# EAGLE schematic LED Driver (EAGLE 9.7.0)
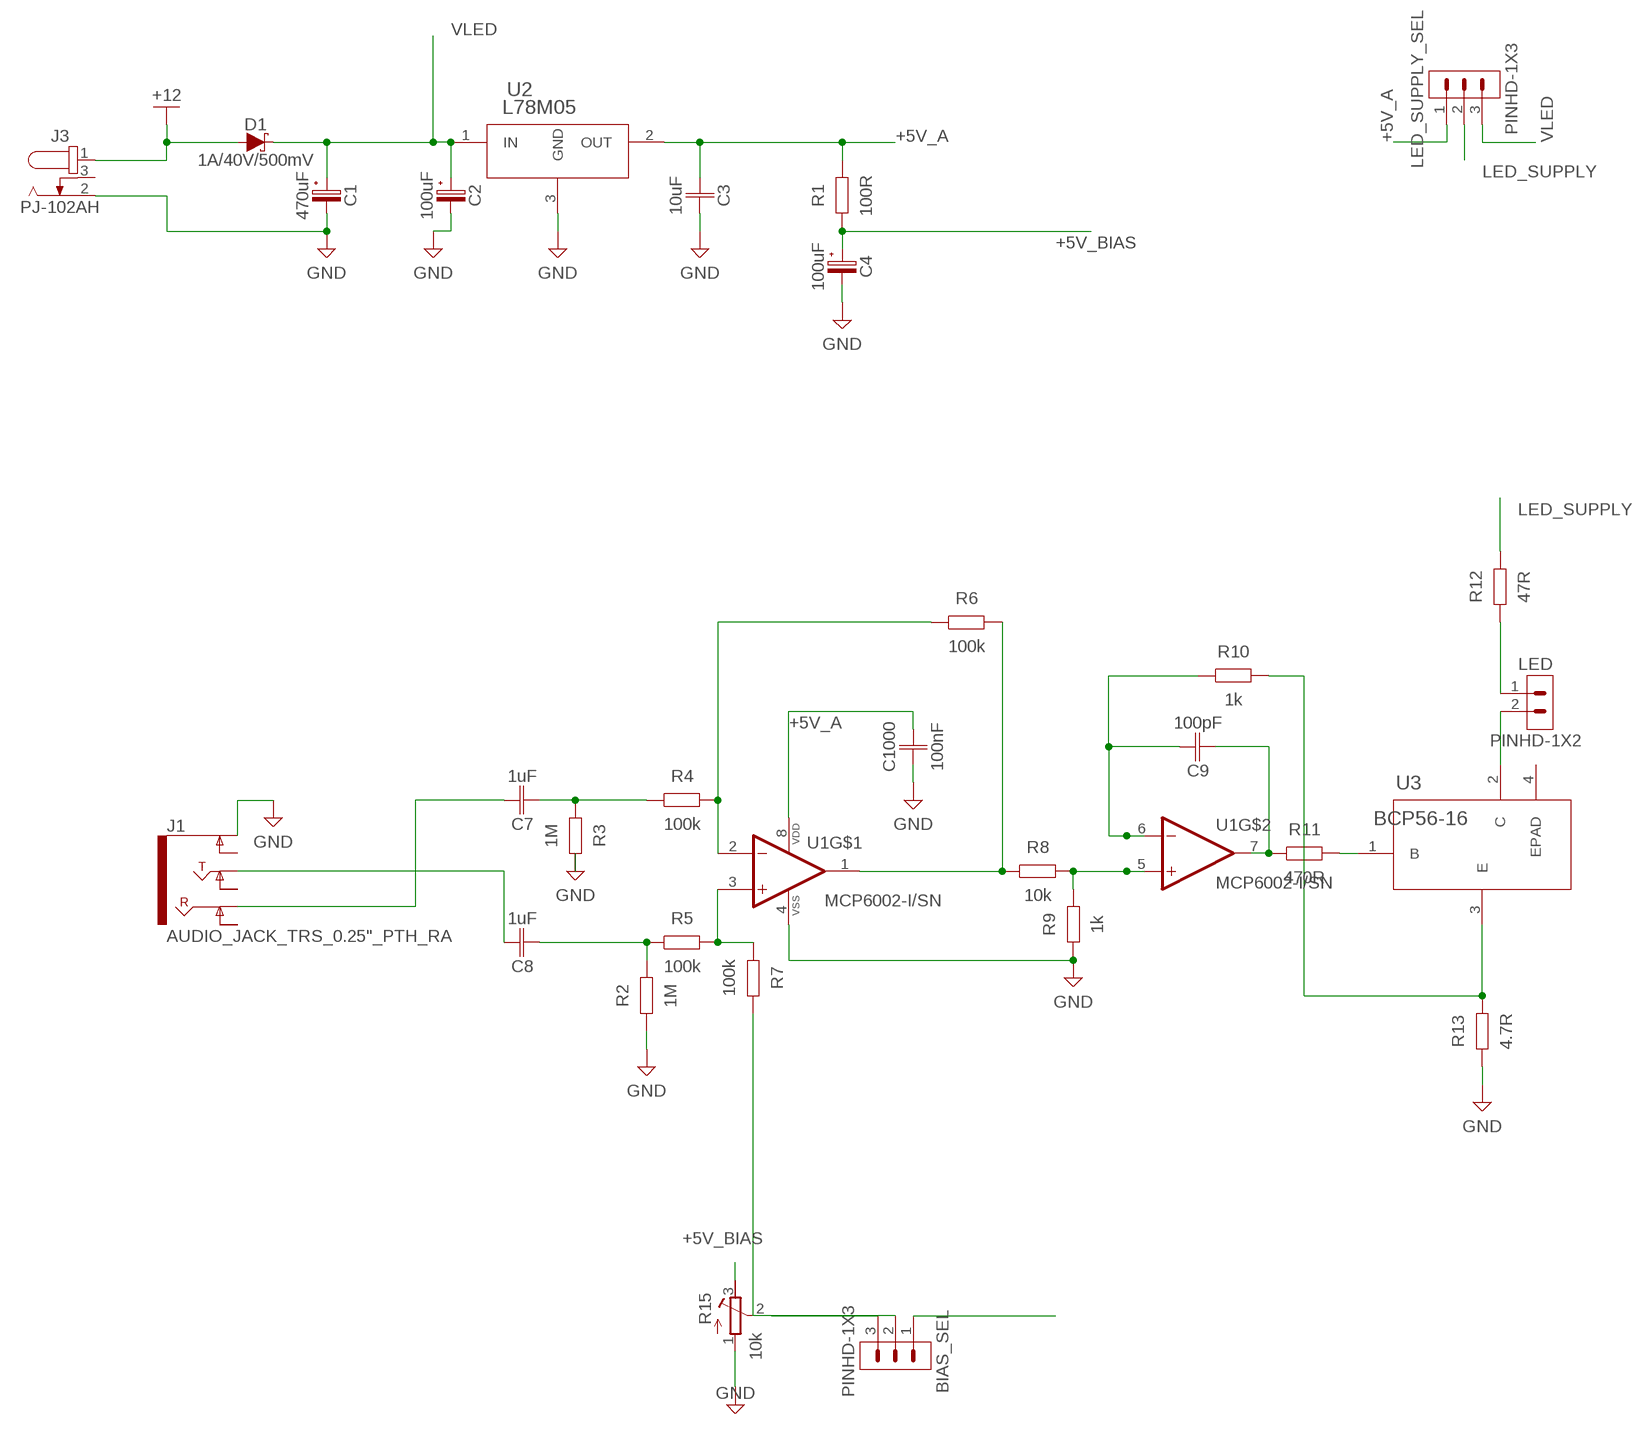
[diagram p0: schematic, sheet 1, part 1 of 2]
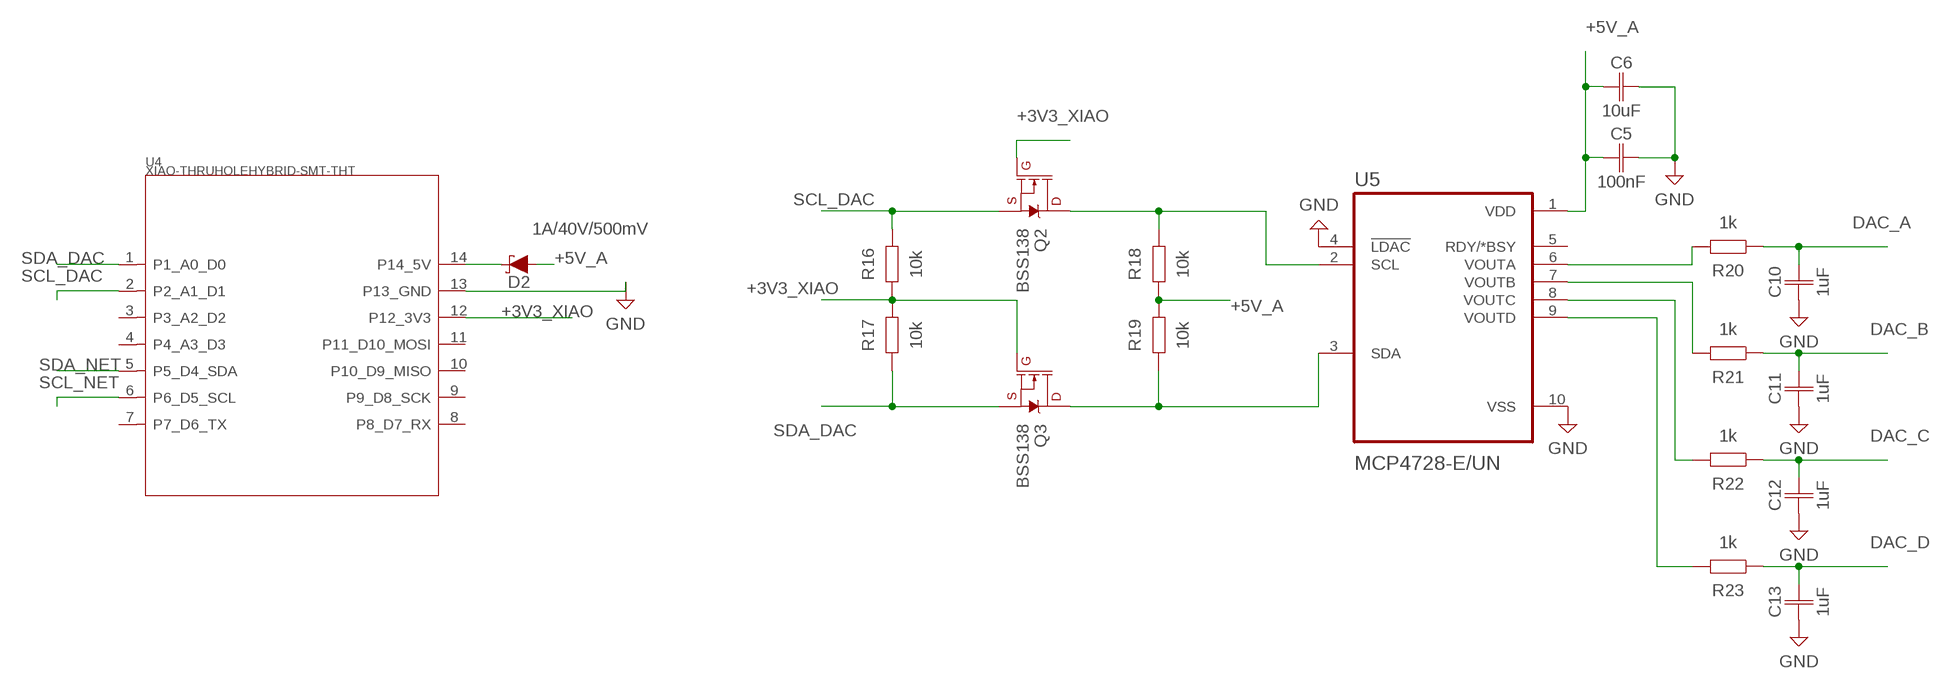
[diagram p1: schematic, sheet 1, part 2 of 2]

## Parts
BIAS_SEL  PINHD-1X3  [1X03]
C1  470uF  C-POL_ECAP-10.5MM  [CAPAE1030X1050N]
C2  100uF  C-POL_ECAP-8.5MM  [CAPAE830X1050N]
C3  10uF  C_CHIP-1206(3216-METRIC)  [CAPC3216X135]
C4  100uF  C-POL_ECAP-8.5MM  [CAPAE830X1050N]
C5  100nF  C_CHIP-0805(2012-METRIC)  [CAPC2012X110]
C6  10uF  C_CHIP-1206(3216-METRIC)  [CAPC3216X135]
C7  1uF  C_CHIP-1206(3216-METRIC)  [CAPC3216X135]
C8  1uF  C_CHIP-1206(3216-METRIC)  [CAPC3216X135]
C9  100pF  C_CHIP-0805(2012-METRIC)  [CAPC2012X110]
C10  1uF  C_CHIP-1206(3216-METRIC)  [CAPC3216X135]
C11  1uF  C_CHIP-1206(3216-METRIC)  [CAPC3216X135]
C12  1uF  C_CHIP-1206(3216-METRIC)  [CAPC3216X135]
C13  1uF  C_CHIP-1206(3216-METRIC)  [CAPC3216X135]
C1000  100nF  C_CHIP-0805(2012-METRIC)  [CAPC2012X110]
D1  1A/40V/500mV  DIODE-SCHOTTKY-SS14  [SMA-DIODE]
D2  1A/40V/500mV  DIODE-SCHOTTKY-SS14  [SMA-DIODE]
J1  AUDIO_JACK_TRS_0.25"_PTH_RA  [AUDIO_JACK_0.25"_TRS_PTH_RA]
J3  PJ-102AH  [PJ-102AH]
LED  PINHD-1X2  [1X02]
LED_SUPPLY_SEL  PINHD-1X3  [1X03]
Q2  BSS138  MOSFET-NCH-BSS138  [SOT23-3]
Q3  BSS138  MOSFET-NCH-BSS138  [SOT23-3]
R1  100R  R_CHIP-1206(3216-METRIC)  [RESC3216X70]
R2  1M  R_CHIP-1206(3216-METRIC)  [RESC3216X70]
R3  1M  R_CHIP-1206(3216-METRIC)  [RESC3216X70]
R4  100k  R_CHIP-1206(3216-METRIC)  [RESC3216X70]
R5  100k  R_CHIP-1206(3216-METRIC)  [RESC3216X70]
R6  100k  R_CHIP-1206(3216-METRIC)  [RESC3216X70]
R7  100k  R_CHIP-1206(3216-METRIC)  [RESC3216X70]
R8  10k  R_CHIP-1206(3216-METRIC)  [RESC3216X70]
R9  1k  R_CHIP-1206(3216-METRIC)  [RESC3216X70]
R10  1k  R_CHIP-1206(3216-METRIC)  [RESC3216X70]
R11  470R  R_CHIP-1206(3216-METRIC)  [RESC3216X70]
R12  47R  R_CHIP-2512(6332-METRIC)  [RESC6332X71]
R13  4.7R  R_CHIP-1206(3216-METRIC)  [RESC3216X70]
R15  10k  R-TRIMM3304W  [RTRIM3304W]
R16  10k  R_CHIP-1206(3216-METRIC)  [RESC3216X70]
R17  10k  R_CHIP-1206(3216-METRIC)  [RESC3216X70]
R18  10k  R_CHIP-1206(3216-METRIC)  [RESC3216X70]
R19  10k  R_CHIP-1206(3216-METRIC)  [RESC3216X70]
R20  1k  R_CHIP-1206(3216-METRIC)  [RESC3216X70]
R21  1k  R_CHIP-1206(3216-METRIC)  [RESC3216X70]
R22  1k  R_CHIP-1206(3216-METRIC)  [RESC3216X70]
R23  1k  R_CHIP-1206(3216-METRIC)  [RESC3216X70]
U1  MCP6002-I/SN  [SOIC127P600X175-8N]
U2  L78M05  L78M05ACDT-TRDPAK_STM  [DPAK_STM]
U3  BCP56-16  BCP56-16T1GSOT-223_3P7X6P7_ONS  [SOT-223_3P7X6P7_ONS]
U4  XIAO-THRUHOLEHYBRID-SMT-THT  [XIAO-GENERIC-HYBRID-MODULE14P-2.54-21X17.8MM]
U5  MCP4728-E/UN  [SOP50P490X110-10N]

## Nets
+3V3_XIAO: Q2.1(G) Q3.1(G) R16.1 R17.2 U4.12(P12_3V3)
+5V_A: C3.1 C5.1 C6.1 C1000.2 D2.A LED_SUPPLY_SEL.1 R1.2 R18.1 R19.2 U1.8(VDD) U2.2(OUT) U5.1(VDD)
+5V_BIAS: C4.1(+) R1.1 R15.3(E)
+12: D1.A J3.1
DAC_A: C10.2 R20.1
DAC_B: C11.2 R21.1
DAC_C: C12.2 R22.1
DAC_D: C13.2 R23.1
GND: C1.2(-) C2.2(-) C3.2 C4.2(-) C5.2 C6.2 C10.1 C11.1 C12.1 C13.1 C1000.1 J1.SLEEVE(EARTH) J3.2 R2.1 R3.2 R9.1 R13.1 R15.1(A) U1.4(VSS) U2.3(GND) U4.13(P13_GND) U5.4(!LDAC) U5.10(VSS)
LED_SUPPLY: LED_SUPPLY_SEL.2 R12.2
N$1: C8.1 R2.2 R5.1
N$2: C7.1 R3.1 R4.1
N$3: R4.2 R6.1 U1.2(VINA-)
N$4: R5.2 R7.1 U1.3(VINA+)
N$5: R6.2 R8.1 U1.1(VOUTA)
N$6: R8.2 R9.2 U1.5(VINB+)
N$7: R11.2 U3.1(B)
N$8: LED.2 U3.2(C)
N$9: LED.1 R12.1
N$10: R10.2 R13.2 U3.3(E)
N$11: C9.1 R11.1 U1.7(VOUTB)
N$12: C9.2 R10.1 U1.6(VINB-)
N$13: BIAS_SEL.3 R15.2(S)
N$14: C8.2 J1.TIP
N$15: C7.2 J1.RING
N$16: BIAS_SEL.2 R7.2
N$17: BIAS_SEL.1
N$22: Q2.3(D) R18.2 U5.2(SCL)
N$23: Q3.3(D) R19.1 U5.3(SDA)
N$24: R20.2 U5.6(VOUTA)
N$25: R21.2 U5.7(VOUTB)
N$26: R22.2 U5.8(VOUTC)
N$27: R23.2 U5.9(VOUTD)
SCL_DAC: Q2.2(S) R16.2 U4.2(P2_A1_D1)
SCL_NET: U4.6(P6_D5_SCL)
SDA_DAC: Q3.2(S) R17.1 U4.1(P1_A0_D0)
SDA_NET: U4.5(P5_D4_SDA)
VLED: C1.1(+) C2.1(+) D1.C LED_SUPPLY_SEL.3 U2.1(IN)
XIAO_5V: D2.C U4.14(P14_5V)
Unconnected: J1.RING-NORM J1.SLEEVE-NORM(EARTH-NORM) J1.TIP-NORM J3.3 U3.4(EPAD) U4.3(P3_A2_D2) U4.4(P4_A3_D3) U4.7(P7_D6_TX) U4.8(P8_D7_RX) U4.9(P9_D8_SCK) U4.10(P10_D9_MISO) U4.11(P11_D10_MOSI) U5.5(RDY/*BSY)

## Library data of the parts
BIAS_SEL LED_SUPPLY_SEL = Connector:PINHD-1X3: Pin Header; CATEGORY_L1: Connectors; CATEGORY_L2: Headers; CATEGORY_L3: Male Pins; DESCRIPTION: Header-Straight-3 Position; PACKAGE: Through Hole; PITCH: 0.100" (2.54mm)
C1 = Capacitor:C-POL: Capacitor Polarised - Generic; CATEGORY_L1: Capacitor; CATEGORY_L2: Aluminum Electrolytic Capacitors; CATEGORY_L3: Radial Can; PACKAGE: Surface Mount; PACKAGE_SIZE: 10.5MM
C2 C4 = Capacitor:C-POL: Capacitor Polarised - Generic; CATEGORY_L1: Capacitor; CATEGORY_L2: Aluminum Electrolytic Capacitors; CATEGORY_L3: Radial Can; PACKAGE: Surface Mount; PACKAGE_SIZE: 8.5MM
C3 C6-C8 C10-C13 = Capacitor:C: Capacitor - Generic; CATEGORY_L1: Capacitor; CATEGORY_L2: Ceramic Capacitors; CATEGORY_L3: MLCC; PACKAGE: Surface Mount; PACKAGE_SIZE: 1206
C5 C9 C1000 = Capacitor:C: Capacitor - Generic; CATEGORY_L1: Capacitor; CATEGORY_L2: Ceramic Capacitors; CATEGORY_L3: MLCC; PACKAGE: Surface Mount; PACKAGE_SIZE: 0805
D1 D2 = SparkFun-DiscreteSemi:DIODE-SCHOTTKY: Schottky diode A Schottky diode is a semiconductor diode which has a low forward voltage drop and a very fast switching action.; PROD_ID: DIO-08053
J1 = SparkFun-Connectors:AUDIO_JACK_TRS_0.25"_PTH_RA: Audio Jack, 1/4" TRS jack, horizontal, PTH, aka "Phono jack" Find the connector here: Audio Jack - 1/4" Stereo (right angle) <https://www.sparkfun.com/products/11144> (COM-11144) Datasheet <http://cdn.sparkfun.com/datasheets/Components/General/JP-611%20DD.jpg> Note, although the datasheet and physical part are slightly different, this footprint was proven to mate well on the Proto Pedal. This device is used on these SparkFun Products: SparkFun TRS Jack Breakout - 1/4" Stereo <https://www.sparkfun.com/products/13005> (BOB-13005 ) SparkFun Proto Pedal - sorry bad link - product comming soon! <https://www.sparkfun.com/products/13124> (PRT-13124); PROD_ID: CONN-12339; SF_ID: COM-11144
J3 = Connector:PJ-102AH: 2.0 x 6.5 mm, 5.0 A, Horizontal, Through Hole, Tapered Pins, Dc Power Jack Connector; CATEGORY_L1: Connectors; CATEGORY_L2: Power Connectors; CATEGORY_L3: DC Jack Male; DATASHEET: https://www.sameskydevices.com/product/resource/pj-102ah.pdf; DESCRIPTION: Power Barrel Connector Jack 2.00mm ID (0.079") & 5.50mm OD (0.217") Through Hole & Right Angle; MANUFACTURER: Same Sky; MPN: PJ-102AH; OPERATING_TEMPERATURE: -25°C ~ 85°C; PACKAGE: Through Hole; PACKAGE_SIZE: NA; PART_STATUS: Active; PITCH: NA; ROHS: Compliant; SERIES: PJ-102
LED = Connector:PINHD-1X2: Pin Header; CATEGORY_L1: Connectors; CATEGORY_L2: Headers; CATEGORY_L3: Male Pins; DESCRIPTION: Header-Straight-2 Position; PACKAGE: Through Hole; PITCH: 0.100" (2.54mm)
Q2 Q3 = SparkFun-DiscreteSemi:MOSFET-NCH: N-channel MOSFETs Voltage controlled devices that allow control of high current outputs. SparkFun Products: SparkFun OpenScale <https://www.sparkfun.com/products/13261> SparkFun Digital Sandbox <https://www.sparkfun.com/products/12651> SparkFun Monster Moto Shield <https://www.sparkfun.com/products/10182> SparkFun MOSFET Power Controller <https://www.sparkfun.com/products/11214>; PROD_ID: TRANS-00830; VALUE: 220mA/50V/3.5Ω
R1-R11 R13 R16-R23 = Resistor:R: Resistor Fixed - Generic; CATEGORY_L1: Resistors; DESCRIPTION: Chip Resistor 3.20 X 1.60 X 0.70 mm body 1206(3216-METRIC) Package; PACKAGE: Surface Mount; PACKAGE_SIZE: 1206
R12 = Resistor:R: Resistor Fixed - Generic; CATEGORY_L1: Resistors; DESCRIPTION: Chip Resistor 6.30 X 3.20 X 0.71 mm body 2512(6332-METRIC) Package; PACKAGE: Surface Mount; PACKAGE_SIZE: 2512
R15 = rcl:R-TRIMM: Trimm resistor; SPICEMODEL: X; SPICEPREFIXL: POT
U1 = MCP6002-I_SN:MCP6002-I/SN: Check availability <https://pricing.snapeda.com/parts/MCP6002-I/SN/Microchip%20Technology/view-part?ref=eda>; AVAILABILITY: In Stock; CHECK_PRICES: https://www.snapeda.com/parts/MCP6002-I/SN/Microchip+Technology/view-part/?ref=eda; DESCRIPTION: Microchip , Dual Op Amp, 1MHzCMOS, Rail to Rail, 3V, 5V, 8-Pin SOIC | Microchip Technology Inc. MCP6002-I/SN; MF: Microchip Technology; MP: MCP6002-I/SN; PACKAGE: SO-8 Microchip; PRICE: None; PURCHASE-URL: https://www.snapeda.com/api/url_track_click_mouser/?unipart_id=6177737&manufacturer=Microchip Technology&part_name=MCP6002-I/SN&search_term=mcp6002-i/sn; SNAPEDA_LINK: https://www.snapeda.com/parts/MCP6002-I/SN/Microchip+Technology/view-part/?ref=snap
U2 = L78M05ACDT:L78M05ACDT-TR; COPYRIGHT: Copyright (C) 2026 Ultra Librarian. All rights reserved.; DATASHEET: https://www.st.com/resource/en/datasheet/l78m.pdf; DESCRIPTION: Precision 500 mA regulators; MANUFACTURER_NAME: STMicroelectronics; MANUFACTURER_PART_NUMBER: L78M05ACDT-TR
U3 = BCP56:BCP56-16T1G; COPYRIGHT: Copyright (C) 2026 Ultra Librarian. All rights reserved.; MANUFACTURER_NAME: onsemi; MANUFACTURER_PART_NUMBER: BCP56-16T1G
U4 = Seeed Studio XIAO Series:XIAO-THRUHOLE: Seeed Studio XIAO Series Through-hole Footprint and Symbol Basic through-hole footprint for Seeed XIAO series of boards. The underside surface mount pads are disabled. For through-hole mounting, a pair of 7-pin, 2.54mm pitch headers with 0.64x0.64mm square leads are recommended. The hybrid variant allows the assembler to choose between surface mount and through-hole mounting methods. However, there is a risk of solder leakage and therefore insufficient solder at the joints if soldering using solder paste and stencils, so we advise using this footprint only when the module is intended to be hand soldered. The symbol pin labels are generic. Please refer to the specific board for more information. Seeed Studio XIAO SAMD21 (Seeeduino XIAO) is also available pre-soldered: Seeed Studio XIAO SAMD21 Pre-soldered - Microchip ATSAMD21G18 Arduino Microcontroller with headers Seeed SKU: 102010388 Buy now <https://www.seeedstudio.com/Seeeduino-XIAO-Pre-Soldered-p-4747.html>
U5 = MCP4728-E_UN:MCP4728-E/UN: Check availability <https://pricing.snapeda.com/parts/MCP4728-E/UN/Microchip/view-part?ref=eda>; AVAILABILITY: In Stock; CHECK_PRICES: https://www.snapeda.com/parts/MCP4728-E/UN/Microchip+Technology/view-part/?ref=eda; DESCRIPTION: Microchip 4-channel 12 bit Serial DAC 10-Pin MSOP | Microchip Technology Inc. MCP4728-E/UN; MF: Microchip; MP: MCP4728-E/UN; PACKAGE: MSOP-10 Microchip; PRICE: None; PURCHASE-URL: https://www.snapeda.com/api/url_track_click_mouser/?unipart_id=43468&manufacturer=Microchip&part_name=MCP4728-E/UN&search_term=mcp4728; SNAPEDA_LINK: https://www.snapeda.com/parts/MCP4728-E/UN/Microchip+Technology/view-part/?ref=snap